# Altium schematic sheet Power.SchDoc
size 420 x 297 mm; SheetNumber: 2; SheetTotal: 5
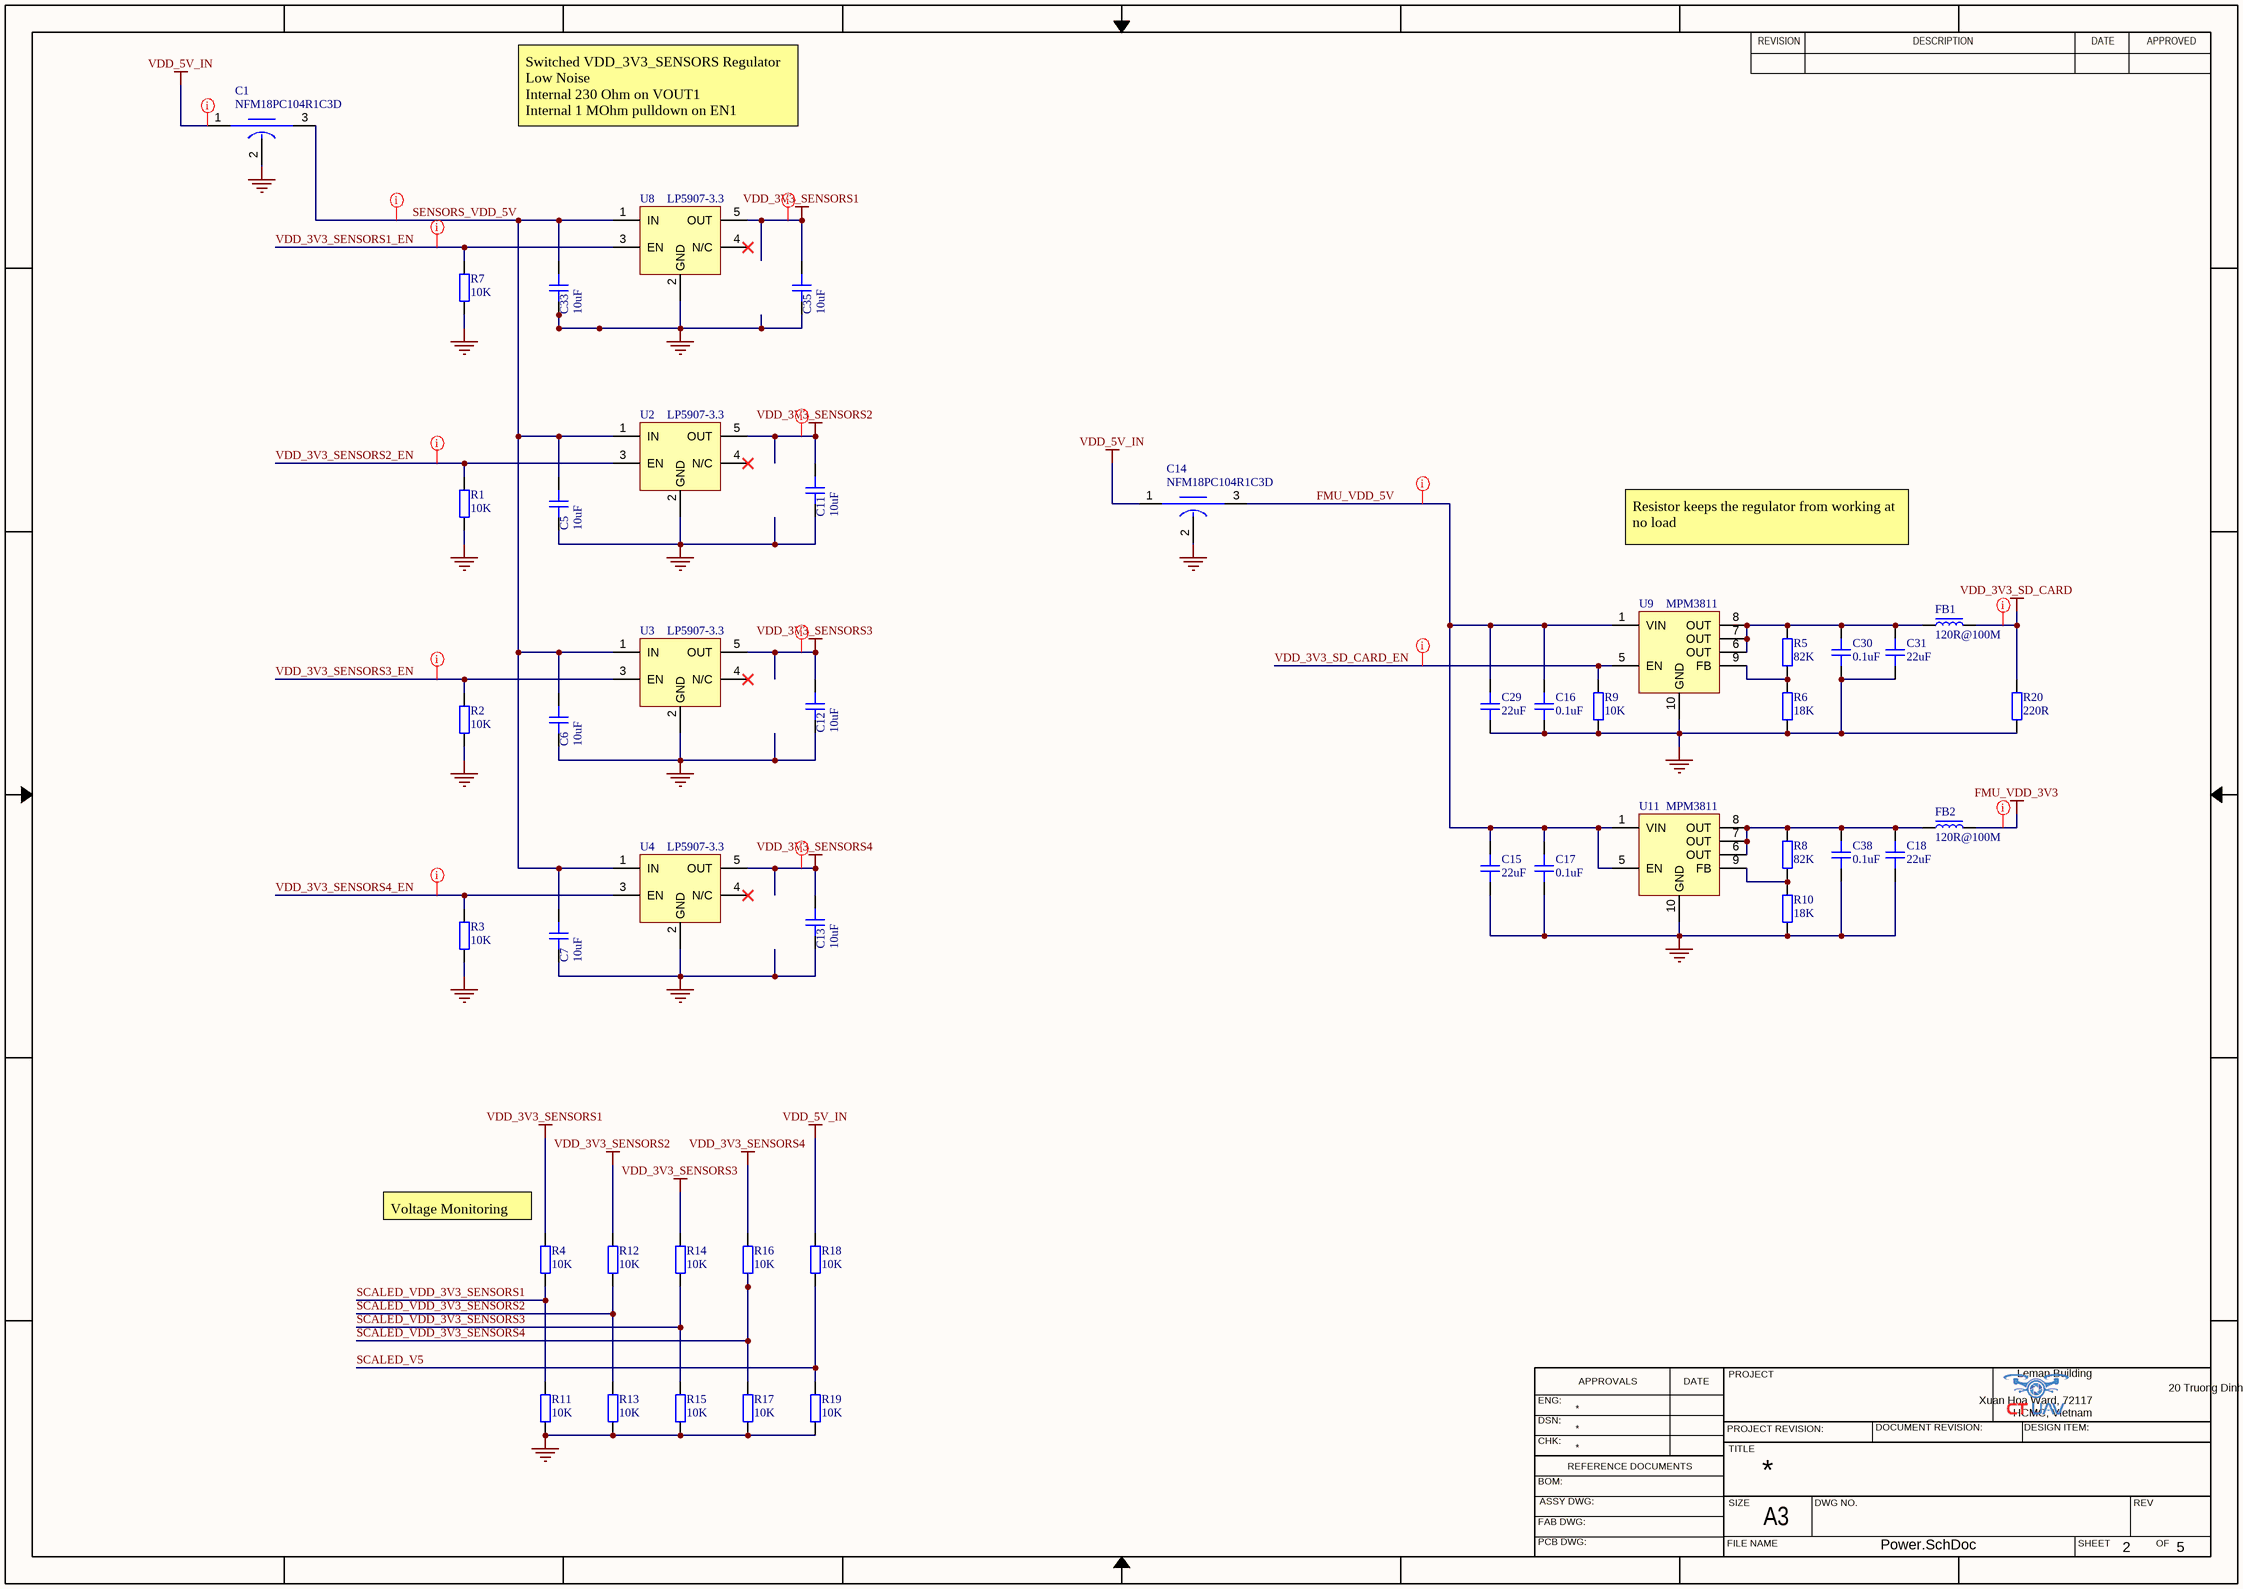
[diagram p0: Power.SchDoc]

## Parts
C1  NFM18PC104R1C3D  [NFM18PC104R1C3_0603_NO_VIA]
C5  10uF  [CAPC1608X10N]
C6  10uF  [CAPC1608X10N]
C7  10uF  [CAPC1608X10N]
C11  10uF  [CAPC1608X10N]
C12  10uF  [CAPC1608X10N]
C13  10uF  [CAPC1608X10N]
C14  NFM18PC104R1C3D  [NFM18PC104R1C3_0603_NO_VIA]
C15  22uF  [CAPC1608X10N]
C16  0.1uF  [CAPC1005X05N]
C17  0.1uF  [CAPC1005X05N]
C18  22uF  [CAPC1608X10N]
C29  22uF  [CAPC1608X10N]
C30  0.1uF  [CAPC1005X05N]
C31  22uF  [CAPC1608X10N]
C33  10uF  [CAPC1608X10N]
C35  10uF  [CAPC1608X10N]
C38  0.1uF  [CAPC1005X05N]
FB1  120R@100M  [INDC1005X06N]
FB2  120R@100M  [INDC1005X06N]
R1  10K  [RESC1005X04N]
R2  10K  [RESC1005X04N]
R3  10K  [RESC1005X04N]
R4  10K  [RESC1005X04N]
R5  82K  [RESC1005X04N]
R6  18K  [RESC1005X04N]
R7  10K  [RESC1005X04N]
R8  82K  [RESC1005X04N]
R9  10K  [RESC1005X04N]
R10  18K  [RESC1005X04N]
R11  10K  [RESC1005X04N]
R12  10K  [RESC1005X04N]
R13  10K  [RESC1005X04N]
R14  10K  [RESC1005X04N]
R15  10K  [RESC1005X04N]
R16  10K  [RESC1005X04N]
R17  10K  [RESC1005X04N]
R18  10K  [RESC1005X04N]
R19  10K  [RESC1005X04N]
R20  220R  [RESC1608X06N]
U2  LP5907-3.3  [SOT-23-5]
U3  LP5907-3.3  [SOT-23-5]
U4  LP5907-3.3  [SOT-23-5]
U8  LP5907-3.3  [SOT-23-5]
U9  MPM3811  [QFN2x2x1p6_MPM3811_MNP]
U11  MPM3811  [QFN2x2x1p6_MPM3811_MNP]

## Nets
FMU_VDD_3V3: FB2.2
GND: C1.2(GND) C5.1 C6.1 C7.1 C11.1 C12.1 C13.1 C14.2(GND) C15.1 C16.1 C17.1 C18.1 C29.1 C30.1 C31.1 C33.1 C35.1 C38.1 R1.2 R2.2 R3.2 R6.1 R7.2 R9.2 R10.1 R11.1 R13.1 R15.1 R17.1 R19.1 R20.1 U2.2(GND) U3.2(GND) U4.2(GND) U8.2(GND) U9.10(GND) U11.10(GND)
VDD_3V3_SD_CARD: FB1.2 R20.2
VDD_3V3_SENSORS1: C35.2 R4.2 U8.5(OUT)
VDD_3V3_SENSORS2: C11.2 R12.2 U2.5(OUT)
VDD_3V3_SENSORS3: C12.2 R14.2 U3.5(OUT)
VDD_3V3_SENSORS4: C13.2 R16.2 U4.5(OUT)
VDD_5V_IN: C1.1(Input) C14.1(Input) R18.2
FMU_VDD_5V: C14.3(Output) C15.2 C16.2 C17.2 C29.2 U9.1(VIN) U11.1(VIN) U11.5(EN)
SCALED_V5: R18.1 R19.2
SCALED_VDD_3V3_SENSORS1: R4.1 R11.2
SCALED_VDD_3V3_SENSORS2: R12.1 R13.2
SCALED_VDD_3V3_SENSORS3: R14.1 R15.2
SCALED_VDD_3V3_SENSORS4: R16.1 R17.2
SENSORS_VDD_5V: C1.3(Output) C5.2 C6.2 C7.2 C33.2 U2.1(IN) U3.1(IN) U4.1(IN) U8.1(IN)
VDD_3V3_SD_CARD_EN: R9.1 U9.5(EN)
VDD_3V3_SENSORS1_EN: R7.1 U8.3(EN)
VDD_3V3_SENSORS2_EN: R1.1 U2.3(EN)
VDD_3V3_SENSORS3_EN: R2.1 U3.3(EN)
VDD_3V3_SENSORS4_EN: R3.1 U4.3(EN)
NetC18_2: C18.2 C38.2 FB2.1 R8.2 U11.6(OUT) U11.7(OUT) U11.8(OUT)
NetC30_2: C30.2 C31.2 FB1.1 R5.2 U9.6(OUT) U9.7(OUT) U9.8(OUT)
NetR5_1: R5.1 R6.2 U9.9(FB)
NetR8_1: R8.1 R10.2 U11.9(FB)

Not connected (* = marked no-connect by the designer): U2 4(N/C)*; U3 4(N/C)*; U4 4(N/C)*; U8 4(N/C)*

## Layout directives
net class Power: FMU_VDD_3V3, FMU_VDD_5V, SENSORS_VDD_5V, VDD_3V3_SD_CARD, VDD_3V3_SD_CARD_EN, VDD_3V3_SENSORS1, VDD_3V3_SENSORS1_EN, VDD_3V3_SENSORS2, VDD_3V3_SENSORS2_EN, VDD_3V3_SENSORS3, VDD_3V3_SENSORS3_EN, VDD_3V3_SENSORS4, VDD_3V3_SENSORS4_EN, VDD_5V_IN

## Notes on the sheet
- Switched VDD_3V3_SENSORS Regulator
  Low Noise
  Internal 230 Ohm on VOUT1
  Internal 1 MOhm pulldown on EN1
- Resistor keeps the regulator from working at no load
- (near R4) Voltage Monitoring
- REVISION
- DESCRIPTION
- DATE
- APPROVED
- ENG:
- APPROVALS
- PROJECT
- Xuan Hoa Ward, 72117
- Leman Building
- 20 Truong Dinh
- DSN:
- CHK:
- REFERENCE DOCUMENTS
- PROJECT REVISION:
- TITLE
- DOCUMENT REVISION:
- DESIGN ITEM:
- HCMC, Vietnam
- BOM:
- FAB DWG:
- PCB DWG:
- ASSY DWG:
- FILE NAME
- SIZE
- A3
- DWG NO.
- SHEET
- REV
- OF

## Library data of the parts
C1 C14 = 968ca41a07abfef6fd4f7114a56c54f: Large Current 3 Terminals Low ESL Chip Multilayer Ceramic Capacitors for General Purpose, 0603, 0.10uF, 20%, 16V; Capacitance: 100nF; Insulation Resistance: 1GR; Current Rating: 2A; DC Resistance (DCR): 30mR; Case Code (Imperial): 0603; REACH SVHC: No SVHC; Width: 0.8mm; Case Code (Metric): 1608; Voltage Rating (DC): 16V; Case/Package: 0603; Packaging: Tape and Reel; Length: 1.6mm; Height: 0.6mm; Voltage: 16V; Depth: 0.8mm; Radiation Hardening: No; Max Operating Temperature: 125°C; Max Voltage Rating (DC): 16V; Voltage Rating: 16V; Max Current Rating: 2A; Tolerance: 20%; Min Operating Temperature: -55°C; Mount: PCB; Termination: Flat; Current: 2A; Package Quantity: 4000; Lead Free: Lead Free
C5-C7 C11-C13 C15 C18 C29 C31 C33 C35 = CAP_0603: Capacitor SMD 0603; Manufacturer: *; Manufacturer Part Number: *; Distributor Link: *; LCSC: *; Rating: *; Dielectric: *
C16 C17 C30 C38 = CAP_0402: Capacitor SMD 0402; Manufacturer: *; Manufacturer Part Number: *; Distributor Link: *; LCSC: *; Rating: *; Dielectric: *
FB1 FB2 = FB_0402: Ferrite Bead SMD 0402; Manufacturer: *; Manufacturer Part Number: *; Distributor Link: *; LCSC: *
R1-R19 = RES_0402: Resistor SMD 0402; Manufacturer: *; Manufacturer Part Number: *; Distributor Link: *; LCSC: *
R20 = RES_0603: Resistor SMD 0603; Manufacturer: *; Manufacturer Part Number: *; Distributor Link: *; LCSC: *
U2-U4 U8 = LP5907-3.3: 82dB@(1kHz) 250mA Fixed 3.3V Positive 5.5V SOT-23-5 Voltage Regulators - Linear, Low Drop Out (LDO) Regulators ROHS
U9 U11 = MPM3811: Non-Isolated PoL Module DC DC Converter 1 Output 0.6 ~ 3.3V 1A 2.3V - 5.5V Input